# Altium schematic sheet MUTE_BUTTONS.SchDoc
size A4; SheetNumber: 5; SheetTotal: 12
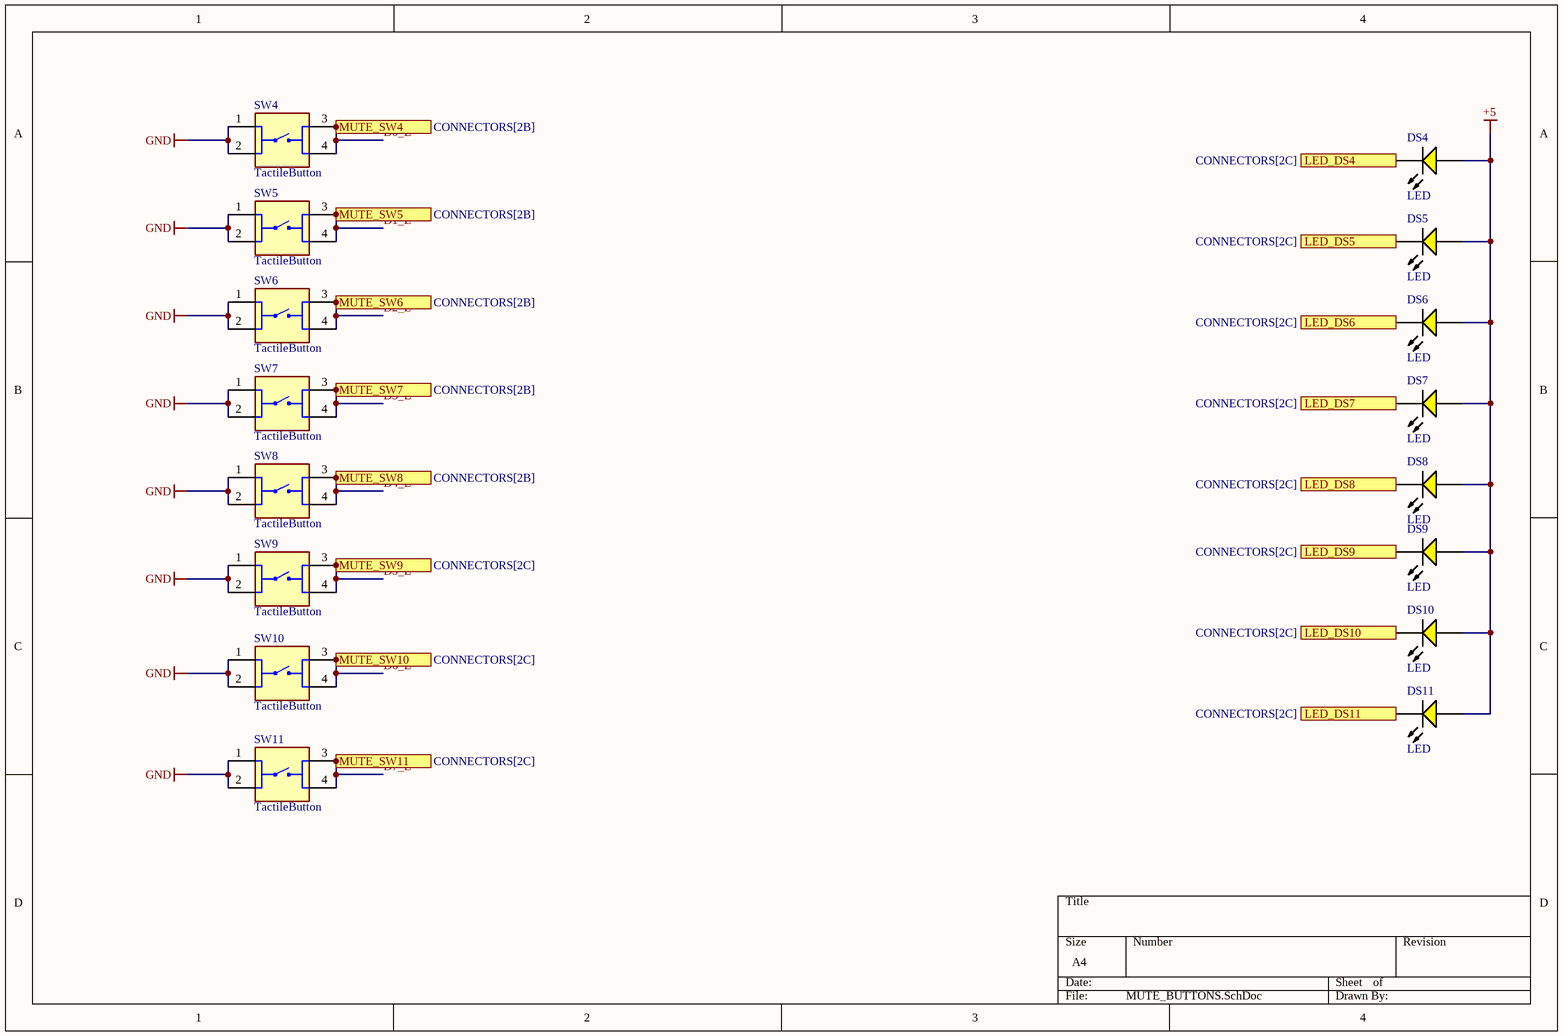
[diagram p0: MUTE_BUTTONS.SchDoc]

## Parts
DS4  LED  [LED_SSL-LX4673GD-LA20]
DS5  LED  [LED_SSL-LX4673GD-LA20]
DS6  LED  [LED_SSL-LX4673GD-LA20]
DS7  LED  [LED_SSL-LX4673GD-LA20]
DS8  LED  [LED_SSL-LX4673GD-LA20]
DS9  LED  [LED_SSL-LX4673GD-LA20]
DS10  LED  [LED_SSL-LX4673GD-LA20]
DS11  LED  [LED_SSL-LX4673GD-LA20]
SW4  TactileButton  [SW_1825910-6-4]
SW5  TactileButton  [SW_1825910-6-4]
SW6  TactileButton  [SW_1825910-6-4]
SW7  TactileButton  [SW_1825910-6-4]
SW8  TactileButton  [SW_1825910-6-4]
SW9  TactileButton  [SW_1825910-6-4]
SW10  TactileButton  [SW_1825910-6-4]
SW11  TactileButton  [SW_1825910-6-4]

## Ports
LED_DS4 (see CONNECTORS[2C]), LED_DS5 (see CONNECTORS[2C]), LED_DS6 (see CONNECTORS[2C]), LED_DS7 (see CONNECTORS[2C]), LED_DS8 (see CONNECTORS[2C]), LED_DS9 (see CONNECTORS[2C]), LED_DS10 (see CONNECTORS[2C]), LED_DS11 (see CONNECTORS[2C]), MUTE_SW4 (see CONNECTORS[2B]), MUTE_SW5 (see CONNECTORS[2B]), MUTE_SW6 (see CONNECTORS[2B]), MUTE_SW7 (see CONNECTORS[2B]), MUTE_SW8 (see CONNECTORS[2B]), MUTE_SW9 (see CONNECTORS[2C]), MUTE_SW10 (see CONNECTORS[2C]), MUTE_SW11 (see CONNECTORS[2C])

## Nets
+5: DS4.1(A) DS5.1(A) DS6.1(A) DS7.1(A) DS8.1(A) DS9.1(A) DS10.1(A) DS11.1(A)
GND: SW4.1 SW4.2 SW5.1 SW5.2 SW6.1 SW6.2 SW7.1 SW7.2 SW8.1 SW8.2 SW9.1 SW9.2 SW10.1 SW10.2 SW11.1 SW11.2
D0_L: SW4.3 SW4.4 ; port MUTE_SW4
D1_L: SW5.3 SW5.4 ; port MUTE_SW5
D2_L: SW6.3 SW6.4 ; port MUTE_SW6
D3_L: SW7.3 SW7.4 ; port MUTE_SW7
D4_L: SW8.3 SW8.4 ; port MUTE_SW8
D5_L: SW9.3 SW9.4 ; port MUTE_SW9
D6_L: SW10.3 SW10.4 ; port MUTE_SW10
D7_L: SW11.3 SW11.4 ; port MUTE_SW11
LED_DS4: DS4.2(K) ; port LED_DS4
LED_DS5: DS5.2(K) ; port LED_DS5
LED_DS6: DS6.2(K) ; port LED_DS6
LED_DS7: DS7.2(K) ; port LED_DS7
LED_DS8: DS8.2(K) ; port LED_DS8
LED_DS9: DS9.2(K) ; port LED_DS9
LED_DS10: DS10.2(K) ; port LED_DS10
LED_DS11: DS11.2(K) ; port LED_DS11

## Library data of the parts
DS4-DS11 = LED-Y: Through Hole Lamp, 2.1 V, -55 to 100 degC, 2-Pin THD, RoHS, Bulk; Luminous Intensity: 200 mcd; Illumination Colour: White; Power Rating: 78 mW; Viewing Angle: 140 degrees; Lens Style: Diffused; Nominal Vf: 3.6 V; Case\Package: 0603; Forward Current: 20 mA; Colour: White; Pins: 2; Mount: Surface Mount; Min Operating Temperature: -40 degC; Radiation Hardening: No; Width: 0.8 mm; PackageDescription: 2-Pin Through Hole Device, Dia 3.8 mm, Pitch 2.54 mm; REACH SVHC: No SVHC; DatasheetVersion: Rev. B, 07/2013; Max Operating Temperature: 85 degC; PackageReference: LTL-1CHYE; ComponentLink2URL: https://datasheet.ciiva.com/4269/s-110-ltl-1chye-4269126.pdf; ComponentLink1URL: http://www.us.liteon.com/; Case Code (Imperial): 0603; Height: 0.6 mm; Packaging: Tape and Reel; ComponentLink2Description: Datasheet; Length: 1.6 mm; Package Quantity: 4000; RoHSCompliant: true; ComponentLink1Description: Manufacturer URL; Case Code (Metric): 1608; Forward Voltage: 3.6 V
SW4-SW11 = TactileButton: FSM4JH=6MM TACT SWITCH, HIGH TEMP; MF: TE Connectivity; MP: 1825910-6; SnapEDA_Link: https://www.snapeda.com/parts/1825910-6/TE+Connectivity+Alcoswitch+Switches/view-part/?ref=snap; Package: None; Value: *; Check_prices: https://www.snapeda.com/parts/1825910-6/TE+Connectivity+Alcoswitch+Switches/view-part/?ref=eda